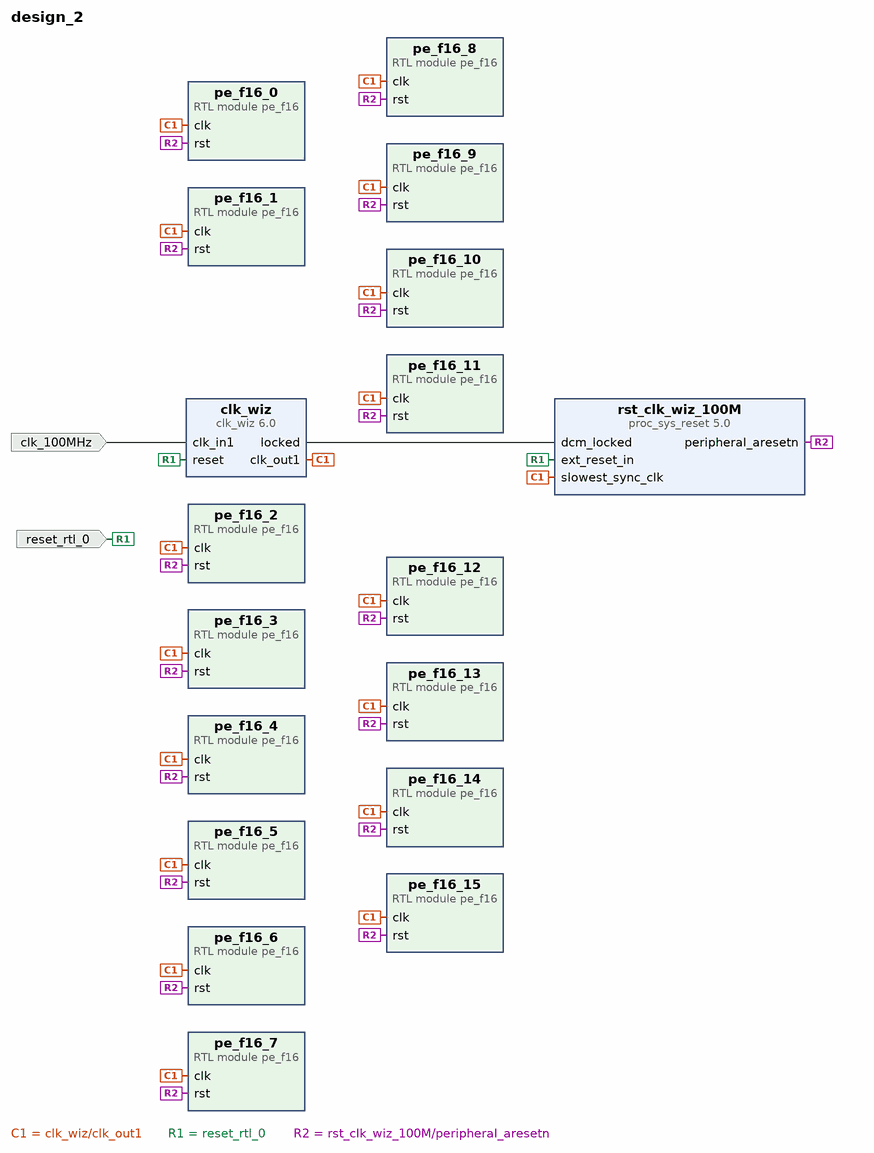
[diagram p0: block diagram of the top level]
# Vivado block design design_2, xcux35-vsva1365-3-e, Vivado 2026.1
create_bd_design design_2

create_bd_port -dir I -type clk clk_100MHz
set_property -dict {CONFIG.FREQ_HZ 100000000} [get_bd_ports clk_100MHz]
create_bd_port -dir I -type rst reset_rtl_0
set_property -dict {CONFIG.POLARITY ACTIVE_HIGH} [get_bd_ports reset_rtl_0]

create_bd_cell -type module -reference pe_f16 pe_f16_0
create_bd_cell -type module -reference pe_f16 pe_f16_1
create_bd_cell -type module -reference pe_f16 pe_f16_2
create_bd_cell -type module -reference pe_f16 pe_f16_3
create_bd_cell -type module -reference pe_f16 pe_f16_5
create_bd_cell -type module -reference pe_f16 pe_f16_6
create_bd_cell -type module -reference pe_f16 pe_f16_7
create_bd_cell -type module -reference pe_f16 pe_f16_8
create_bd_cell -type module -reference pe_f16 pe_f16_4
create_bd_cell -type module -reference pe_f16 pe_f16_9
create_bd_cell -type module -reference pe_f16 pe_f16_10
create_bd_cell -type module -reference pe_f16 pe_f16_11
create_bd_cell -type module -reference pe_f16 pe_f16_12
create_bd_cell -type module -reference pe_f16 pe_f16_13
create_bd_cell -type module -reference pe_f16 pe_f16_14
create_bd_cell -type module -reference pe_f16 pe_f16_15
create_bd_cell -type ip -vlnv xilinx.com:ip:clk_wiz:6.0 clk_wiz
set_property -dict {CONFIG.CLKOUT1_REQUESTED_OUT_FREQ 100.0} [get_bd_cells clk_wiz]
create_bd_cell -type ip -vlnv xilinx.com:ip:proc_sys_reset:5.0 rst_clk_wiz_100M

# ---- connections ----

connect_bd_net [get_bd_ports clk_100MHz] [get_bd_pins clk_wiz/clk_in1]
connect_bd_net [get_bd_pins clk_wiz/clk_out1] \
  [get_bd_pins pe_f16_0/clk] [get_bd_pins rst_clk_wiz_100M/slowest_sync_clk] [get_bd_pins pe_f16_1/clk] \
  [get_bd_pins pe_f16_2/clk] [get_bd_pins pe_f16_3/clk] [get_bd_pins pe_f16_4/clk] [get_bd_pins pe_f16_5/clk] \
  [get_bd_pins pe_f16_6/clk] [get_bd_pins pe_f16_7/clk] [get_bd_pins pe_f16_8/clk] [get_bd_pins pe_f16_9/clk] \
  [get_bd_pins pe_f16_10/clk] [get_bd_pins pe_f16_11/clk] [get_bd_pins pe_f16_12/clk] [get_bd_pins pe_f16_13/clk] \
  [get_bd_pins pe_f16_14/clk] [get_bd_pins pe_f16_15/clk]
connect_bd_net [get_bd_pins clk_wiz/locked] [get_bd_pins rst_clk_wiz_100M/dcm_locked]
connect_bd_net -net reset_rtl_0_1 [get_bd_ports reset_rtl_0] [get_bd_pins clk_wiz/reset] [get_bd_pins rst_clk_wiz_100M/ext_reset_in]
connect_bd_net [get_bd_pins rst_clk_wiz_100M/peripheral_aresetn] \
  [get_bd_pins pe_f16_0/rst] [get_bd_pins pe_f16_1/rst] [get_bd_pins pe_f16_2/rst] [get_bd_pins pe_f16_3/rst] \
  [get_bd_pins pe_f16_4/rst] [get_bd_pins pe_f16_5/rst] [get_bd_pins pe_f16_6/rst] [get_bd_pins pe_f16_7/rst] \
  [get_bd_pins pe_f16_8/rst] [get_bd_pins pe_f16_9/rst] [get_bd_pins pe_f16_10/rst] [get_bd_pins pe_f16_11/rst] \
  [get_bd_pins pe_f16_12/rst] [get_bd_pins pe_f16_13/rst] [get_bd_pins pe_f16_14/rst] [get_bd_pins pe_f16_15/rst]

validate_bd_design
save_bd_design
